# Altium schematic sheet SCH_main.SchDoc: Brain Board
size 297 x 209 mm; SPICEModelCacheJUPSVLAV: <root> / <DocumentId>JUPSVLAV</DocumentId> / </root>; DrawnBy: Adnan CATAL; SheetNumber: 2; SheetTotal: 3; Designer: Adnan CATAL; Projet: Pamis; Title2: MCU Schematic
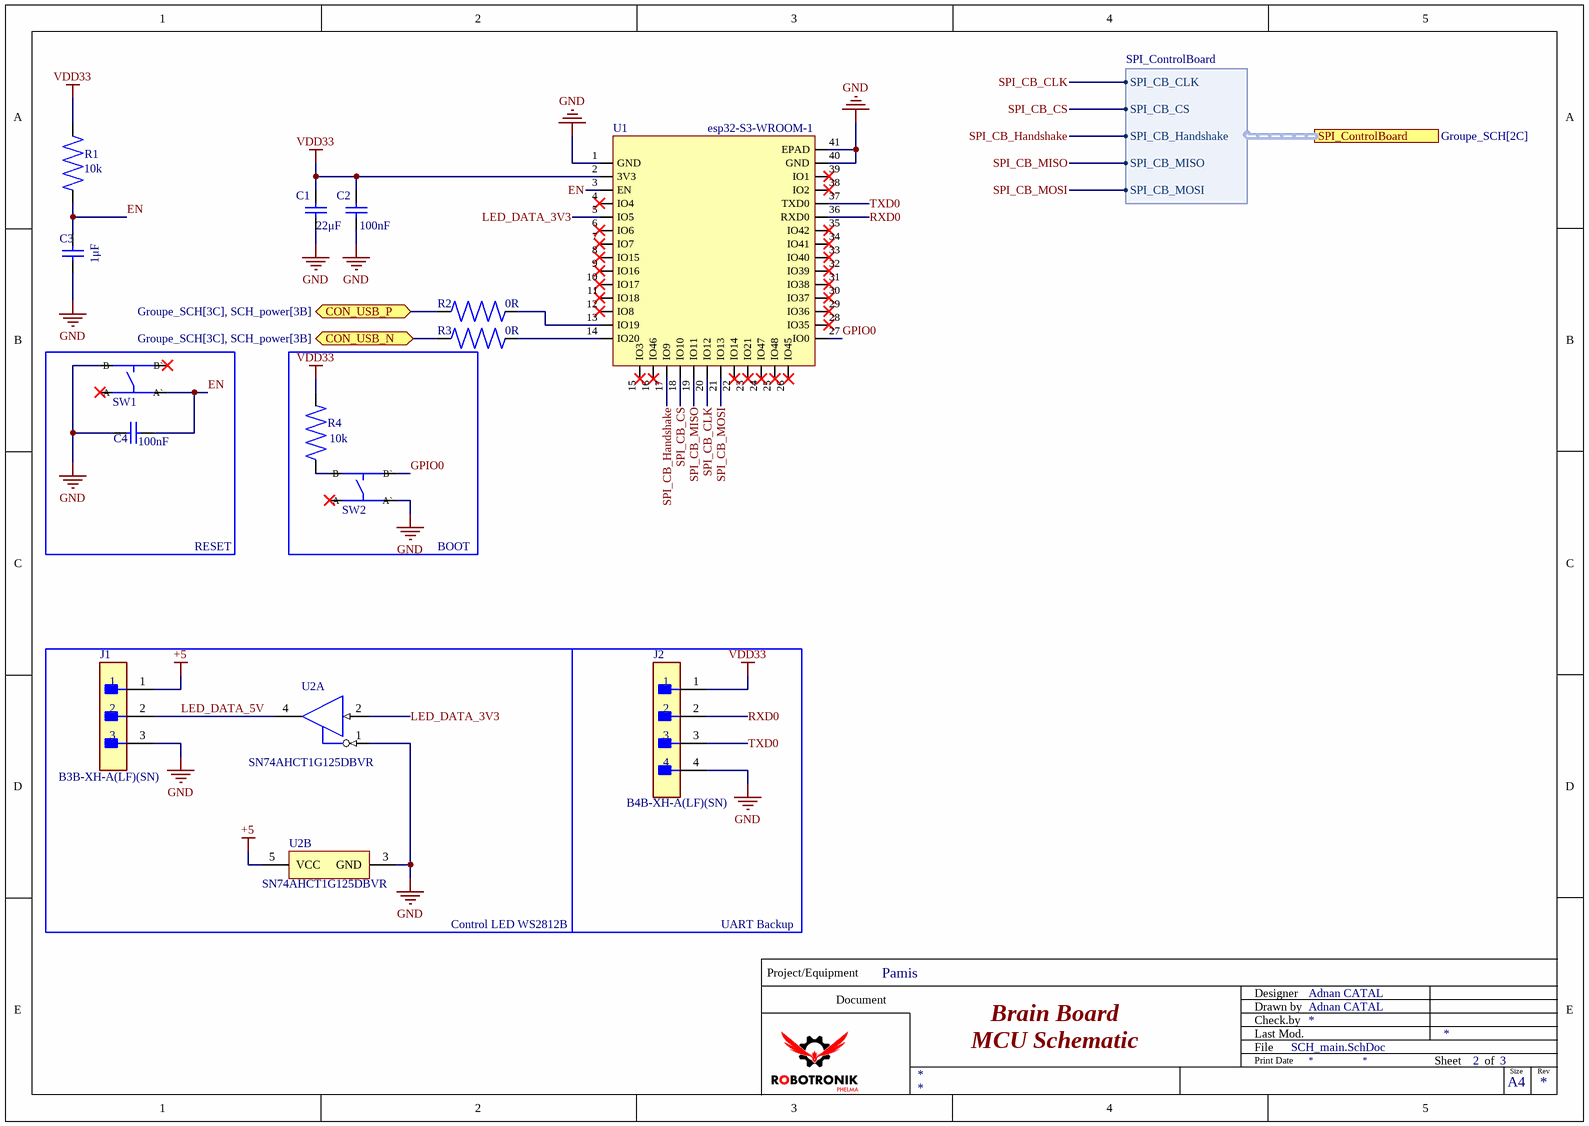
[diagram p0: SCH_main.SchDoc]

## Parts
C1  22μF  [WCAP-CSGP_0603_L1.6W0.8H0.8_Reflow]
C2  100nF  [WCAP-CSGP_0603_L1.6W0.8H0.8_Reflow]
C3  1μF  [WCAP-CSGP_0603_L1.6W0.8H0.8_Reflow]
C4  100nF  [WCAP-CSGP_0603_L1.6W0.8H0.8_Reflow]
J1  B3B-XH-A(LF)(SN)  [FP-B3B-XH-A_LF_SN-MFG]
J2  B4B-XH-A(LF)(SN)  [FP-B4B-XH-A_LF_SN-MFG]
R1  10k  [RESC1608X06N]
R2  0R  [RESC1608X06N]
R3  0R  [RESC1608X06N]
R4  10k  [RESC1608X06N]
SW1  EVQ-Q2S02W  [EVQQ2S02W]  (value not drawn)
SW2  EVQ-Q2S02W  [EVQQ2S02W]  (value not drawn)
U1  esp32-S3-WROOM-1  [XCVR_ESP32-S3-WROOM-1-N8R2]
U2  SN74AHCT1G125DBVR  [DBV0005A_L]  (parts A,B of 2)

## Blocks framed on the sheet
RESET: C4 SW1
BOOT: R4 SW2
Control LED WS2812B: J1 U2

## Ports
CON_USB_N (bidir, see Groupe_SCH[3C], SCH_power[3B]), CON_USB_P (bidir, see Groupe_SCH[3C], SCH_power[3B]), SPI_ControlBoard (harness SPI_ControlBoard, see Groupe_SCH[2C])

## Harnesses
SPI_ControlBoard: SPI_CB_MOSI, SPI_CB_MISO, SPI_CB_Handshake, SPI_CB_CS, SPI_CB_CLK

## Nets
+5: J1.1 U2.5(VCC)
GND: C1.1 C2.2 C3.1 C4.1 J1.3 J2.4 SW1.1(B) SW2.3(A`) U1.1(GND) U1.40(GND) U1.41(EPAD) U2.1(~{OE}) U2.3(GND)
VDD33: C1.2 C2.1 J2.1 R1.1 R4.2 U1.2(3V3)
CON_USB_N: R3.1 ; port CON_USB_N
CON_USB_P: R2.1 ; port CON_USB_P
EN: C3.2 C4.2 R1.2 SW1.3(A`) U1.3(EN)
GPIO0: SW2.4(B`) U1.27(IO0)
LED_DATA_3V3: U1.5(IO5) U2.2(A)
LED_DATA_5V: J1.2 U2.4(Y)
RXD0: J2.2 U1.36(RXD0)
SPI_CB_CLK: U1.20(IO12) ; port SPI_ControlBoard.SPI_CB_CLK
SPI_CB_CS: U1.18(IO10) ; port SPI_ControlBoard.SPI_CB_CS
SPI_CB_Handshake: U1.17(IO9) ; port SPI_ControlBoard.SPI_CB_Handshake
SPI_CB_MISO: U1.19(IO11) ; port SPI_ControlBoard.SPI_CB_MISO
SPI_CB_MOSI: U1.21(IO13) ; port SPI_ControlBoard.SPI_CB_MOSI
TXD0: J2.3 U1.37(TXD0)
NetR2_2: R2.2 U1.13(IO19)
NetR3_2: R3.2 U1.14(IO20)
NetR4_1: R4.1 SW2.1(B)

Not connected (* = marked no-connect by the designer): SW1 2(A)* 4(B`)*; SW2 2(A)*; U1 4(IO4)* 6(IO6)* 7(IO7)* 8(IO15)* 9(IO16)* 10(IO17)* 11(IO18)* 12(IO8)* 15(IO3)* 16(IO46)* 22(IO14)* 23(IO21)* 24(IO47)* 25(IO48)* 26(IO45)* 28(IO35)* 29(IO36)* 30(IO37)* 31(IO38)* 32(IO39)* 33(IO40)* 34(IO41)* 35(IO42)* 38(IO2)* 39(IO1)*

## Notes on the sheet
- UART Backup
- Project/Equipment
- Document
- Designer
- Drawn by
- Check.by
- File
- Last Mod.
- Print Date
- Sheet
- of
- Size
- A4
- Rev

## Library data of the parts
C1 = 885012106032: WCAP-CSGP Multilayer Ceramic Chip Capacitor, General Purpose, size 0603, 22μF, 10V; Manufacturer: Wurth Elektronik; Case/Size Code: 0603; Capacitance Tolerance: +/-20%; Ceramic Type: X5R Class II; Dissipation Factor: 20%; Insulation Resistance: 0.002GΩ; Technical Reference: X5R0603226M010DFCT10000; Manufacturer Part Number: 885012106032; Category: Multilayer Ceramic Chip Capacitors; Match Code: WCAP-CSGP; ComponentLink1Description: Website Link; ComponentLink1URL: https://www.we-online.com/redexpert/article/885012106032?ad; ComponentLink2Description: Datasheet Link; ComponentLink2URL: https://www.we-online.com/redexpert/spec/885012106032?ad; Mount: Surface Mount; Min Operating Temperature: -55°C; Max Operating Temperature: 85°C; Packaging: Tape and Reel; Length: 1.6mm; Width: 0.8mm; Height: 0.8mm; Capacitance: 22μF; Rated Voltage (DC): 10V
C2 C4 = 885012206046: WCAP-CSGP Multilayer Ceramic Chip Capacitor, General Purpose, size 0603, 100nF, 16V; Manufacturer: Wurth Elektronik; Case/Size Code: 0603; Capacitance Tolerance: +/-10%; Ceramic Type: X7R; Dissipation Factor: 3.5%; Insulation Resistance: 5GΩ; Technical Reference: X7R0603104K016DFCT10000; Manufacturer Part Number: 885012206046; Category: Multilayer Ceramic Chip Capacitors; Match Code: WCAP-CSGP; ComponentLink1Description: Website Link; ComponentLink1URL: https://www.we-online.com/redexpert/article/885012206046?ad; ComponentLink2Description: Datasheet Link; ComponentLink2URL: https://www.we-online.com/redexpert/spec/885012206046?ad; Mount: Surface Mount; Min Operating Temperature: -55°C; Max Operating Temperature: 125°C; Packaging: Tape and Reel; Length: 1.6mm; Width: 0.8mm; Height: 0.8mm; Capacitance: 100nF; Rated Voltage (DC): 16V
C3 = 885012106003: WCAP-CSGP Multilayer Ceramic Chip Capacitor, General Purpose, size 0603, 1μF, 6.3V; Manufacturer: Wurth Elektronik; Case/Size Code: 0603; Capacitance Tolerance: +/-20%; Ceramic Type: X5R; Dissipation Factor: 10%; Insulation Resistance: 0.1GΩ; Technical Reference: X5R0603105M6R3DFCT10000; Manufacturer Part Number: 885012106003; Category: Multilayer Ceramic Chip Capacitors; Match Code: WCAP-CSGP; ComponentLink1Description: Website Link; ComponentLink1URL: https://www.we-online.com/redexpert/article/885012106003?ad; ComponentLink2Description: Datasheet Link; ComponentLink2URL: https://www.we-online.com/redexpert/spec/885012106003?ad; Mount: Surface Mount; Min Operating Temperature: -55°C; Max Operating Temperature: 85°C; Packaging: Tape and Reel; Length: 1.6mm; Width: 0.8mm; Height: 0.8mm; Capacitance: 1μF; Rated Voltage (DC): 6.3V
J1 = CMP-17439-000014-3: CONN HEADER VERT 3POS 2.5MM; Max Voltage Rating (DC): 250V; Number of Positions: 3; Current Rating: 3A; Gender: Male; Wire/Cable Gauge: 22AWG; Contact Resistance: 20mR; Insulation Resistance: 1GR; Insulation Material: Nylon; Contact Plating: Tin; Depth: 5.75mm; Contact Type: Male Pin; Max Operating Temperature: 85°C; Insulation Color: Natural; Voltage Rating (AC): 250V; Color: Natural; Connector Type: Header; Orientation: Straight; Fastening Type: Detent; Housing Color: White; Min Operating Temperature: -25°C; Termination: Solder; Voltage Rating: 250V; Series: XH; Pitch: 2.5mm; Contact Shape: Square; Number of Rows: 1; Lead Free: Lead Free; Packaging: Bulk; Mount: Through Hole; Flammability Rating: UL94 V-0; Max Voltage Rating (AC): 250V; REACH SVHC: No SVHC; Housing Material: Polyamide; Contact Material: Brass; Lead Pitch: 2.5mm; Contact Finish - Mating: TIN; Length: 9.9mm; Max Current Rating: 3A; Number of Contacts: 3
J2 = CMP-17439-000250-1: CONN HEADER VERT 4POS 2.5MM; Number of Contacts: 4; Contact Resistance: 20mR; Voltage Rating: 250V; Max Current Rating: 3A; Gender: Male; Wire/Cable Gauge: 22AWG; Mated Stacking Heights: 9.8mm; Insulation Resistance: 1GR; Orientation: Straight; Contact Type: Male Pin; Contact Finish - Mating: TIN; Series: XH; Max Voltage Rating (AC): 250V; Lead Pitch: 2.5mm; Contact Shape: Square; Insulation Color: Natural; Termination: Solder; Lead Free: Lead Free; Voltage Rating (AC): 250V; Number of Rows: 1; Flammability Rating: UL94 V-0; Number of Positions: 4; Max Operating Temperature: 85°C; Package Quantity: 500; Mount: Through Hole; REACH SVHC: No SVHC; Connector Type: Header; Insulation Material: Nylon; Fastening Type: Detent; Min Operating Temperature: -25°C; Housing Color: White; Packaging: Bulk; Contact Plating: Tin; Contact Material: Brass; Max Voltage Rating (DC): 250V; Housing Material: Polyamide; Color: Natural; Material: Polyamide; Pitch: 2.5mm; Depth: 5.75mm; Current Rating: 3A; Length: 12.4mm
R1 R4 = Resistance 10k 0603 1%: Tolerance: 1%; Power (W): 0,1; Value: 10k; Package: 0603
R2 R3 = Resistance 0R 0603 jumper: Power (W): 0,1; Value: 0R; Tolerance: -; Package: 0603
SW1 SW2 = EVQ-Q2S02W: Switch Tactile ON OFF SPST Round Button J-Bend 0.02A 15VDC 1.6N SMD Embossed T/R; Manufacturer: Panasonic; Manufacturer Lifecycle Status: ACTIVE; Actuator Length: 711.2µm; Actuator Material: Polyphthalamide; Contact Current Rating: 20mA; Contact Resistance: 100mΩ; Electrical Life: 1Mcycles; Illumination Type: Illuminated, Non-Illuminated; Max Voltage Rating (AC): 250V; Max Voltage Rating (DC): 15V; Number of Positions: 1; Switch Function: Off-Mom; Switch Travel: 250µm; Supplier: DigiKey; Supplier Part Number: P12951SCT-ND; Manufacturer Part Number: EVQ-Q2S02W; RoHS: Compliant; Category: Tactile Switches; Stock: 21774; Case/Package: SMD/SMT; Color: White; Contact Material: Brass, Stainless Steel; Contact Plating: Silver; Current Rating: 20mA; Depth: 6.6mm; Dielectric Material: Polyphthalamide; Height: 1.8mm; Housing Material: Stainless Steel; Insulation Resistance: 100MΩ; Lead Free: Lead Free; Length: 6.5mm; Life (Cycles): 1Mcycles; Lifecycle Status: Production; Max Current Rating: 20mA; Max Operating Temperature: 85°C; Mechanical Life: 1Mcycles; Min Operating Temperature: -40°C; Mounting Technology: Surface Mount; Operating Force: 1.6N; Radiation Hardening: No; REACH SVHC: Unaffected; Termination: Solder; Thickness: 1.8mm; Throw Configuration: SPST; Voltage Rating (AC): 250V; Voltage Rating (DC): 15V; Width: 6mm; ComponentLink1URL: https://datasheet.octopart.com:443/EVQ-Q2S02W-Panasonic-datasheet-138897726.pdf?src-supplier=Upverter; ComponentLink1Description: https://datasheet.octopart.com:443/EVQ-Q2S02W-Panasonic-datasheet-138897726.pdf?src-supplier=Upverter; ComponentLink2URL: https://datasheet.octopart.com:443/EVQ-Q2S02W-Panasonic-datasheet-59328990.pdf?src-supplier=IHS; ComponentLink2Description: https://datasheet.octopart.com:443/EVQ-Q2S02W-Panasonic-datasheet-59328990.pdf?src-supplier=IHS; ComponentLink3URL: https://datasheet.octopart.com/EVQ-Q2S02W-Panasonic-datasheet-13267673.pdf; ComponentLink3Description: https://datasheet.octopart.com/EVQ-Q2S02W-Panasonic-datasheet-13267673.pdf; ComponentLink4URL: https://datasheet.octopart.com:443/EVQ-Q2S02W-Panasonic-datasheet-41178988.pdf?src-supplier=element14+APAC; ComponentLink4Description: https://datasheet.octopart.com:443/EVQ-Q2S02W-Panasonic-datasheet-41178988.pdf?src-supplier=element14+APAC; ComponentLink5URL: https://datasheet.octopart.com:443/EVQ-Q2S02W-Panasonic-datasheet-130260655.pdf?src-supplier=TME; ComponentLink5Description: https://datasheet.octopart.com:443/EVQ-Q2S02W-Panasonic-datasheet-130260655.pdf?src-supplier=TME; ComponentLink6URL: https://datasheet.octopart.com:443/EVQ-Q2S02W-Panasonic-datasheet-78834757.pdf?src-supplier=Newark; ComponentLink6Description: https://datasheet.octopart.com:443/EVQ-Q2S02W-Panasonic-datasheet-78834757.pdf?src-supplier=Newark; ComponentLink7URL: https://datasheet.octopart.com:443/EVQQ2S02W-Panasonic-datasheet-5314136.pdf?src-supplier=Farnell; ComponentLink7Description: https://datasheet.octopart.com:443/EVQQ2S02W-Panasonic-datasheet-5314136.pdf?src-supplier=Farnell; ComponentLink8URL: https://datasheet.octopart.com:443/EVQ-Q2S02W-Panasonic-datasheet-106547821.pdf?src-supplier=Sager+Electronics; ComponentLink8Description: https://datasheet.octopart.com:443/EVQ-Q2S02W-Panasonic-datasheet-106547821.pdf?src-supplier=Sager+Electronics; ComponentLink9URL: https://datasheet.octopart.com:443/EVQ-Q2S02W-Panasonic-datasheet-98950118.pdf?src-supplier=Future+Electronics; ComponentLink9Description: https://datasheet.octopart.com:443/EVQ-Q2S02W-Panasonic-datasheet-98950118.pdf?src-supplier=Future+Electronics; ComponentLink10URL: https://datasheet.octopart.com:443/EVQ-Q2S02W-Panasonic-datasheet-118699.pdf?src-supplier=DigiKey; ComponentLink10Description: https://datasheet.octopart.com:443/EVQ-Q2S02W-Panasonic-datasheet-118699.pdf?src-supplier=DigiKey
U1 = esp32-S3-WROOM-1: Rf Txrx Module Bt Pcb Trace SMD; Manufacturer: Espressif Systems; Manufacturer Part Number: ESP32-S3-WROOM-1-N4; Max Supply Voltage: 3.6V; Min Supply Voltage: 3V; Nominal Supply Voltage (DC): 3.3V; Supplier: DigiKey; Supplier Part Number: 1965-ESP32-S3-WROOM-1-N4TR-ND; RoHS: Compliant; Category: RF Receivers, Transceivers; Country of Origin: Vietnam; Height - Seated (Max): 3.25mm; Harmonized Tariff Schedule (HTS) Code: 8542.31.00.30; Length: 25.5mm; Max Operating Temperature: 85°C; Min Operating Temperature: -40°C; Number of Terminals: 41; REACH SVHC: Unaffected; Terminal Pitch: 1.27mm; Width: 18mm; ComponentLink1URL: https://datasheet.octopart.com:443/ESP32-S3-WROOM-1-N4-Espressif-Systems-datasheet-165560563.pdf?src-supplier=IHS; ComponentLink1Description: https://datasheet.octopart.com:443/ESP32-S3-WROOM-1-N4-Espressif-Systems-datasheet-165560563.pdf?src-supplier=IHS; ComponentLink2URL: https://datasheet.octopart.com:443/ESP32-S3-WROOM-1-N4-Espressif-Systems-datasheet-192340060.pdf?src-supplier=LCSC; ComponentLink2Description: https://datasheet.octopart.com:443/ESP32-S3-WROOM-1-N4-Espressif-Systems-datasheet-192340060.pdf?src-supplier=LCSC; ComponentLink3URL: https://datasheet.octopart.com:443/ESP32-S3-WROOM-1-N4-Espressif-Systems-datasheet-188867343.pdf?src-supplier=TME; ComponentLink3Description: https://datasheet.octopart.com:443/ESP32-S3-WROOM-1-N4-Espressif-Systems-datasheet-188867343.pdf?src-supplier=TME; ComponentLink4URL: https://datasheet.octopart.com:443/ESP32-S3-WROOM-1-N4-Espressif-Systems-datasheet-165560559.pdf?src-supplier=TME; ComponentLink4Description: https://datasheet.octopart.com:443/ESP32-S3-WROOM-1-N4-Espressif-Systems-datasheet-165560559.pdf?src-supplier=TME
U2 = CMP-0859-00079-3: Single Bus Buffer Gate With 3-State Output, DBV0005A, LARGE T&R; Manufacturer: Texas Instruments; Voltage(Nom)(V): 5; Schmitt Trigger: No; F @ Nom Voltage(Max)(Mhz): 75; Technology Family: AHCT; Logic: True; VCC(Max)(V): 5.5; Input Type: CMOS; Sub-Family: Non-Inverting Buffer/Driver; ICC @ Nom Voltage(Max)(mA): 0.01; Output Drive (IOL/IOH)(Max)(mA): 8/-8; VCC(Min)(V): 2; Rating: Catalog; Bits(#): 1; tpd @ Nom Voltage(Max)(ns): 6; 3-State Output: Yes; PackageReference: DBV0005A; DatasheetVersion: SCLS378M; Generic Part Number: SN74AHCT1G125; Output Type: CMOS; Operating Temperature Range(C): -40 to 125